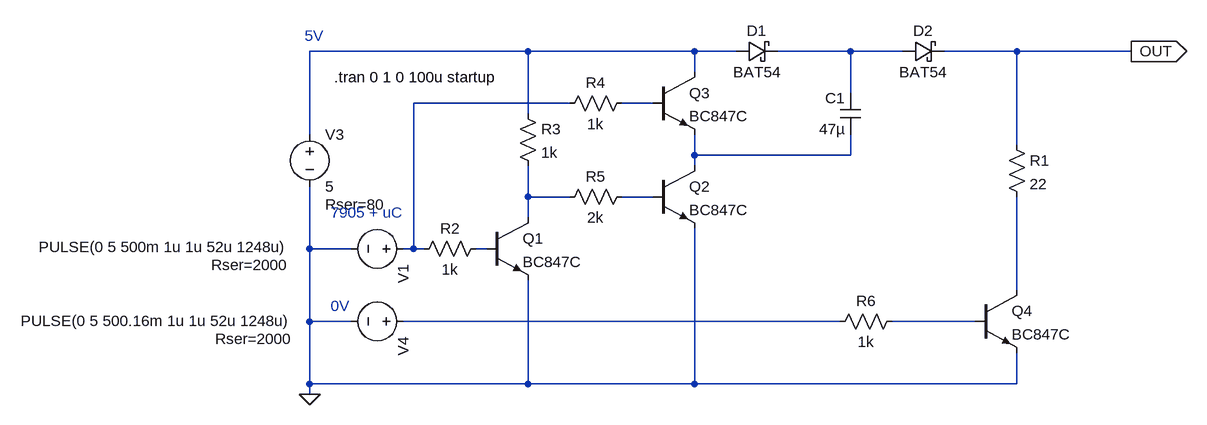
[diagram p0: schematic DriverA6.asc]
DriverA6.asc, the LTspice schematic file:
Version 4
SHEET 1 1244 804
WIRE 208 16 -128 16
WIRE 464 16 208 16
WIRE 528 16 464 16
WIRE 704 16 592 16
WIRE 784 16 704 16
WIRE 960 16 848 16
WIRE 1136 16 960 16
WIRE 464 48 464 16
WIRE 704 80 704 16
WIRE 272 96 32 96
WIRE 400 96 352 96
WIRE 208 112 208 16
WIRE -128 144 -128 16
WIRE 960 160 960 16
WIRE 464 176 464 144
WIRE 704 176 704 144
WIRE 704 176 464 176
WIRE 464 192 464 176
WIRE 208 240 208 192
WIRE 272 240 208 240
WIRE 400 240 352 240
WIRE 208 272 208 240
WIRE -128 320 -128 224
WIRE -64 320 -128 320
WIRE 32 320 32 96
WIRE 32 320 16 320
WIRE 48 320 32 320
WIRE 144 320 128 320
WIRE 960 384 960 240
WIRE -128 432 -128 320
WIRE -64 432 -128 432
WIRE 688 432 16 432
WIRE 896 432 768 432
WIRE -128 528 -128 432
WIRE 208 528 208 368
WIRE 208 528 -128 528
WIRE 464 528 464 288
WIRE 464 528 208 528
WIRE 960 528 960 480
WIRE 960 528 464 528
WIRE -128 544 -128 528
FLAG 1136 16 OUT
IOPIN 1136 16 Out
FLAG -128 544 0
SYMBOL voltage 32 320 R90
WINDOW 3 -3 192 VRight 2
WINDOW 123 0 0 Left 0
WINDOW 39 25 192 VRight 2
SYMATTR InstName V1
SYMATTR Value PULSE(0 5 500m 1u 1u 52u 1248u)
SYMATTR SpiceLine Rser=2000
SYMBOL cap 720 144 R180
WINDOW 0 24 56 Left 2
WINDOW 3 24 8 Left 2
SYMATTR InstName C1
SYMATTR Value 47µ
SYMBOL schottky 528 32 R270
WINDOW 0 32 32 VTop 2
WINDOW 3 0 32 VBottom 2
SYMATTR InstName D1
SYMATTR Value BAT54
SYMATTR Description Diode
SYMATTR Type diode
SYMBOL schottky 784 32 R270
WINDOW 0 32 32 VTop 2
WINDOW 3 0 32 VBottom 2
SYMATTR InstName D2
SYMATTR Value BAT54
SYMATTR Description Diode
SYMATTR Type diode
SYMBOL voltage -128 128 R0
WINDOW 123 0 0 Left 0
WINDOW 39 24 124 Left 2
SYMATTR InstName V3
SYMATTR Value 5
SYMATTR SpiceLine Rser=80
SYMBOL npn 144 272 R0
SYMATTR InstName Q1
SYMATTR Value BC847C
SYMBOL res 144 304 R90
WINDOW 0 0 56 VBottom 2
WINDOW 3 32 56 VTop 2
SYMATTR InstName R2
SYMATTR Value 1k
SYMBOL res 192 96 R0
SYMATTR InstName R3
SYMATTR Value 1k
SYMBOL npn 400 192 R0
SYMATTR InstName Q2
SYMATTR Value BC847C
SYMBOL res 368 224 R90
WINDOW 0 0 56 VBottom 2
WINDOW 3 32 56 VTop 2
SYMATTR InstName R5
SYMATTR Value 2k
SYMBOL npn 400 48 R0
SYMATTR InstName Q3
SYMATTR Value BC847C
SYMBOL res 368 80 R90
WINDOW 0 0 56 VBottom 2
WINDOW 3 32 56 VTop 2
SYMATTR InstName R4
SYMATTR Value 1k
SYMBOL voltage 32 432 R90
WINDOW 3 -1 186 VRight 2
WINDOW 123 0 0 Left 0
WINDOW 39 27 186 VRight 2
SYMATTR InstName V4
SYMATTR Value PULSE(0 5 500.16m 1u 1u 52u 1248u)
SYMATTR SpiceLine Rser=2000
SYMBOL res 784 416 R90
WINDOW 0 0 56 VBottom 2
WINDOW 3 32 56 VTop 2
SYMATTR InstName R6
SYMATTR Value 1k
SYMBOL npn 896 384 R0
SYMATTR InstName Q4
SYMATTR Value BC847C
SYMBOL res 944 144 R0
SYMATTR InstName R1
SYMATTR Value 22
TEXT -90 56 Left 2 !.tran 0 1 0 100u startup
TEXT -96 264 Left 2 ;7905 + uC
TEXT -136 -8 Left 2 ;5V
TEXT -96 408 Left 2 ;0V

The netlist it stands for:
* DriverA6.asc
V1 N003 0 PULSE(0 5 500m 1u 1u 52u 1248u) Rser=2000
C1 N005 N002 47µ
D1 N001 N002 BAT54
D2 N002 OUT BAT54
V3 N001 0 5 Rser=80
Q1 N006 N008 0 0 BC847C
R2 N008 N003 1k
R3 N001 N006 1k
Q2 N005 N007 0 0 BC847C
R5 N007 N006 2k
Q3 N001 N004 N005 0 BC847C
R4 N004 N003 1k
V4 N010 0 PULSE(0 5 500.16m 1u 1u 52u 1248u) Rser=2000
R6 N011 N010 1k
Q4 N009 N011 0 0 BC847C
R1 OUT N009 22
.model D D
.lib standard.dio
.model NPN NPN
.model PNP PNP
.lib standard.bjt
.tran 0 1 0 100u startup
* 7905 + uC
* 5V
* 0V
.backanno
.end